# Altium schematic sheet 200_DC-DC.SchDoc: DC-DC Convertion stage
size A4; Date: XXXXXX; Author: Y.Gonzalez; Revision: R1V0; SheetNumber: 3; SheetTotal: 5
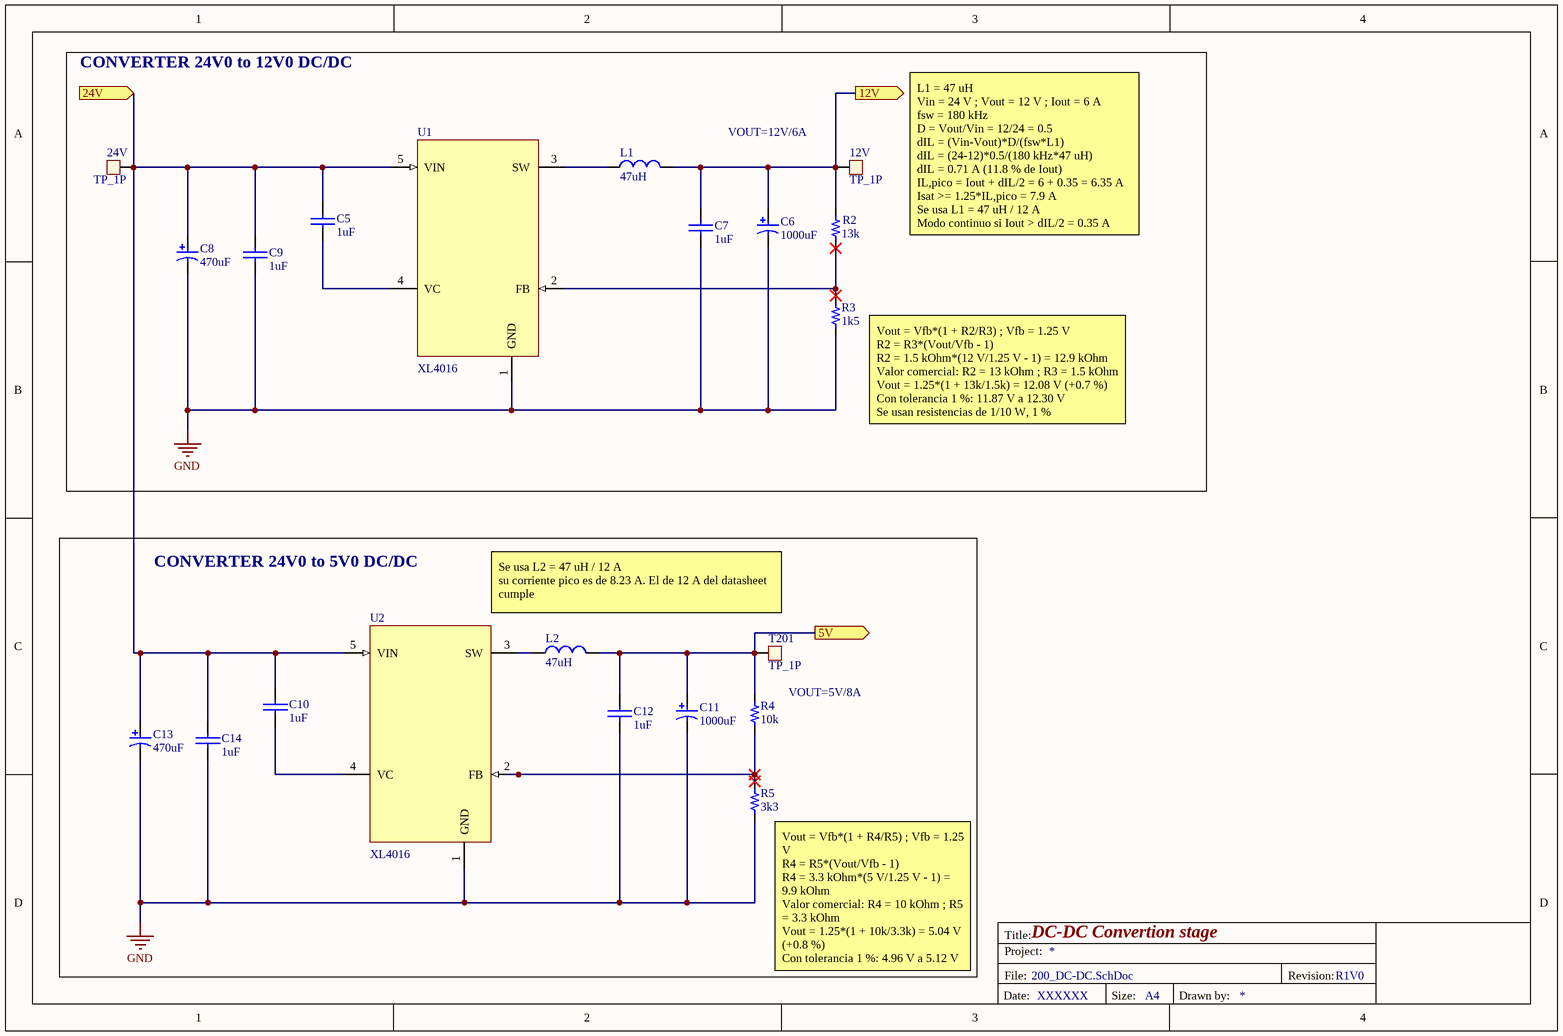
[diagram p0: 200_DC-DC.SchDoc]

## Parts
12V  TP_1P  [TP_TH_30mil]  (no BOM)
24V  TP_1P  [TP_TH_30mil]  (no BOM)
C5  value 1uF  [1206]  (hidden comment: 1uF 100V)
C6  value 1000uF  [RADIAL-CAN_LSx5mm_Diax10mm_Hx14mm]  (hidden comment: 1000uF 25V)
C7  value 1uF  [0805]  (hidden comment: 1uF 25V)
C8  value 470uF  [RADIAL-CAN-SMD_DIAX8MM_HX10MM]  (hidden comment: 470uF 10V)
C9  value 1uF  [1206]  (hidden comment: 1uF 100V)
C10  value 1uF  [1206]  (hidden comment: 1uF 100V)
C11  value 1000uF  [RADIAL-CAN_LSx5mm_Diax10mm_Hx14mm]  (hidden comment: 1000uF 25V)
C12  value 1uF  [0805]  (hidden comment: 1uF 25V)
C13  value 470uF  [RADIAL-CAN-SMD_DIAX8MM_HX10MM]  (hidden comment: 470uF 10V)
C14  value 1uF  [1206]  (hidden comment: 1uF 100V)
L1  value 47uH  [L_47uH_12A]  (hidden comment: FIXED IND 47UH 12A 12.2 MOHM SMD)
L2  value 47uH  [L_47uH_12A]  (hidden comment: FIXED IND 47UH 12A 12.2 MOHM SMD)
R2  value 13k  [0201]  (hidden comment: 13k 1/20W)
R3  value 1k5  [0402]  (hidden comment: 1k5 1/16W)
R4  value 10k  [0402]  (hidden comment: 10k 1/16W)
R5  value 3k3  [0402]  (hidden comment: 3k3 1/16W)
T201  TP_1P  [TP_TH_30mil]  (no BOM)
U1  XL4016  [TO-263-5]
U2  XL4016  [TO-263-5]

## Blocks framed on the sheet
CONVERTER 24V0 to 12V0 DC/DC: 12V 24V C5-C9 L1 R2 R3 U1
CONVERTER 24V0 to 5V0 DC/DC: C10-C14 L2 R4 R5 T201 U2

## Ports
5V (out), 12V (out), 24V (in)

## Nets
GND: C6.2 C7.2 C8.2 C9.2 C11.2 C12.2 C13.2 C14.2 R3.1 R5.1 U1.1(GND) U2.1(GND)
5V: C11.1 C12.1 L2.2 R4.2 T201.1 ; port 5V
12V: 12V.1 C6.1 C7.1 L1.2 R2.2 ; port 12V
24V: 24V.1 C5.1 C8.1 C9.1 C10.1 C13.1 C14.1 U1.5(VIN) U2.5(VIN) ; port 24V
NetC5_2: C5.2 U1.4(VC)
NetC10_2: C10.2 U2.4(VC)
NetL1_1: L1.1 U1.3(SW)
NetL2_1: L2.1 U2.3(SW)
NetR2_1: R2.1 R3.2 U1.2(FB)
NetR4_1: R4.1 R5.2 U2.2(FB)

## Notes on the sheet
- VOUT=12V/6A
- L1 = 47 uH
  Vin = 24 V ; Vout = 12 V ; Iout = 6 A
  fsw = 180 kHz
  D = Vout/Vin = 12/24 = 0.5
  dIL = (Vin-Vout)*D/(fsw*L1)
  dIL = (24-12)*0.5/(180 kHz*47 uH)
  dIL = 0.71 A (11.8 % de Iout)
  IL,pico = Iout + dIL/2 = 6 + 0.35 = 6.35 A
  Isat >= 1.25*IL,pico = 7.9 A
  Se usa L1 = 47 uH / 12 A
  Modo continuo si Iout > dIL/2 = 0.35 A
- (near R3) Vout = Vfb*(1 + R2/R3) ; Vfb = 1.25 V
  R2 = R3*(Vout/Vfb - 1)
  R2 = 1.5 kOhm*(12 V/1.25 V - 1) = 12.9 kOhm
  Valor comercial: R2 = 13 kOhm ; R3 = 1.5 kOhm
  Vout = 1.25*(1 + 13k/1.5k) = 12.08 V (+0.7 %)
  Con tolerancia 1 %: 11.87 V a 12.30 V
  Se usan resistencias de 1/10 W, 1 %
- Se usa L2 = 47 uH / 12 A
  su corriente pico es de 8.23 A. El de 12 A del datasheet cumple
- VOUT=5V/8A
- (near R5) Vout = Vfb*(1 + R4/R5) ; Vfb = 1.25 V
  R4 = R5*(Vout/Vfb - 1)
  R4 = 3.3 kOhm*(5 V/1.25 V - 1) = 9.9 kOhm
  Valor comercial: R4 = 10 kOhm ; R5 = 3.3 kOhm
  Vout = 1.25*(1 + 10k/3.3k) = 5.04 V (+0.8 %)
  Con tolerancia 1 %: 4.96 V a 5.12 V
  Se usan resistencias de 1/10 W, 1 %
- Title:
- Project:
- File:
- Revision:
- Date:
- Size:
- A4
- Drawn by:

## Library data of the parts
12V 24V T201 = TP_TH_30mil: Test point 30mil hole size; Last modified by: J.Jaramillo; Last modified date: 20240310
C5 C9 C10 C14 = Cap_1uF_1206_100V: CAP CER 1UF 100V X7R 1206; Manufacturer: Samsung Electro-Mechanics; Manufacturer Part Number: CL31B105KCHSNNE; Supplier 1: Digi-Key; Supplier Part Number 1: 1276-2747-1-ND; Last modified by: J.Jaramillo; Last modified date: 20240309; ComponentLink1Description: Digi-Key; ComponentLink1URL: https://www.digikey.com/en/products/detail/samsung-electro-mechanics/CL31B105KCHSNNE/3888405
C6 C11 = Cap_1000uF_25V_ALU_THT: CAP 1000uf/25V,10*16,105℃ RADIAL; Manufacturer: SamXon; Manufacturer Part Number: KM 1000U/25V; Last modified by: J.Jaramillo; Last modified date: 20240309; Supplier 1: Poshton; Supplier Part Number 1: KM 1000U/25V
C7 C12 = Cap_1uF_0805_25V: CAP CER 1UF 25V X7R 0805; Manufacturer: Yageo; Manufacturer Part Number: CC0805KKX7R8BB105; Supplier 1: Digi-Key; Supplier Part Number 1: 311-1456-1-ND; Last modified by: J.Jaramillo; Last modified date: 20240309; ComponentLink1Description: Digi-Key; ComponentLink1URL: https://www.digikey.com/product-detail/en/yageo/CC0805KKX7R8BB105/311-1456-1-ND/2833762
C8 C13 = Cap_470uF_10V_ALU_SMD: 470uF 10V ±20% SMD,D8xL10mm Aluminum Electrolytic Capacitors; Manufacturer: Lelon; Manufacturer Part Number: VZH471M1ATT-0810L; Supplier 1: LCSC; Supplier Part Number 1: C723180; Last modified by: J.Jaramillo; Last modified date: 20240309; ComponentLink1Description: LCSC; ComponentLink1URL: https://lcsc.com/product-detail/Aluminum-Electrolytic-Capacitors-SMD_Lelon-VZH471M1ATT-0810L_C723180.html
L1 L2 = L_47uH_12A: Manufacturer: Würth Elektronik; Manufacturer Part Number: 7443634700; Supplier 1: Digi-Key; Supplier Part Number 1: 732-2525-1-ND; Reel Stock: N/A; Last modified by: Y.Gonzalez; Last modified date: 23102026
R2 = Res_13k_0201_1/20W: RES SMD 13K OHM 1% 1/20W 0201; Manufacturer: YAGEO; Manufacturer Part Number: AC0201FR-0713KL; Supplier 1: DIGI-KEY; Supplier Part Number 1: YAG5154CT-ND; Reel Stock: N/A; Last modified by: J.Jaramillo; Last modified date: 20240310; ComponentLink1Description: Digi-Key; ComponentLink1URL: https://www.digikey.com/en/products/detail/yageo/AC0201FR-0713KL/5894273?s=N4IgTCBcDaIJoEEDiBWAjCgLAYQCoFoA5AERAF0BfIA
R3 = Res_1K5_0402_1/16W: RES SMD 1.5K OHM 5% 1/16W 0402; Manufacturer: Yageo; Manufacturer Part Number: RC0402JR-071K5L; Supplier 1: Digi-Key; Supplier Part Number 1: 311-1.5KJRCT-ND; Reel Stock: N/A; Last modified by: J.Jaramillo; Last modified date: 20240310; ComponentLink1Description: Link; ComponentLink1URL: https://www.digikey.com/product-detail/en/yageo/RC0402JR-071K5L/311-1-5KJRCT-ND/729359
R4 = Res_10k_0402_1/16W: RES SMD 10K OHM 1% 1/16W 0402; Manufacturer: Yageo; Manufacturer Part Number: RC0402FR-0710KL; Supplier 1: Digi-Key; Supplier Part Number 1: 311-10.0KLRCT-ND; Reel Stock: N/A; Last modified by: J.Jaramillo; Last modified date: 20240310; ComponentLink1Description: Digi-Key; ComponentLink1URL: https://www.digikey.com/en/products/detail/yageo/RC0402FR-0710KL/726523?s=N4IgTCBcDaIEoGEAMAWJYBicC0SDsAjEgNIAyIAugL5A
R5 = Res_3k3_0402_1/16W: RES SMD 3.3K OHM 5% 1/16W 0402; Manufacturer: Yageo; Manufacturer Part Number: RC0402JR-073K3L; Supplier 1: Digi-Key; Supplier Part Number 1: 311-3.3KJRCT-ND; Reel Stock: N/A; Last modified by: J.Jaramillo; Last modified date: 20240310; ComponentLink1Description: Digi-Key; ComponentLink1URL: https://www.digikey.com/product-detail/en/yageo/RC0402JR-073K3L/311-3-3KJRCT-ND/729403
U1 U2 = DCDC_ADJ_12A_TO-220-5L: 180 KHz fixed frequency PWM buck (step-down) DC/DC converter, capable of driving a 12A load with high efficiency; Manufacturer: XLSEMI; Manufacturer Part Number: XL4016; Supplier 1: LCSC; Supplier Part Number 1: C55881; Reel Stock: N/A; Last modified by: Y.Gonzalez; Last modified date: 22102026; ComponentLink1Description: LCSC; ComponentLink1URL: https://www.lcsc.com/product-detail/C55881.html; ComponentLink2Description: Datasheet; ComponentLink2URL: https://www.snapeda.com/parts/XL4016/XLSEMI/datasheet/